# EasyEDA Pro project 恒温器.eprj, board PCB3
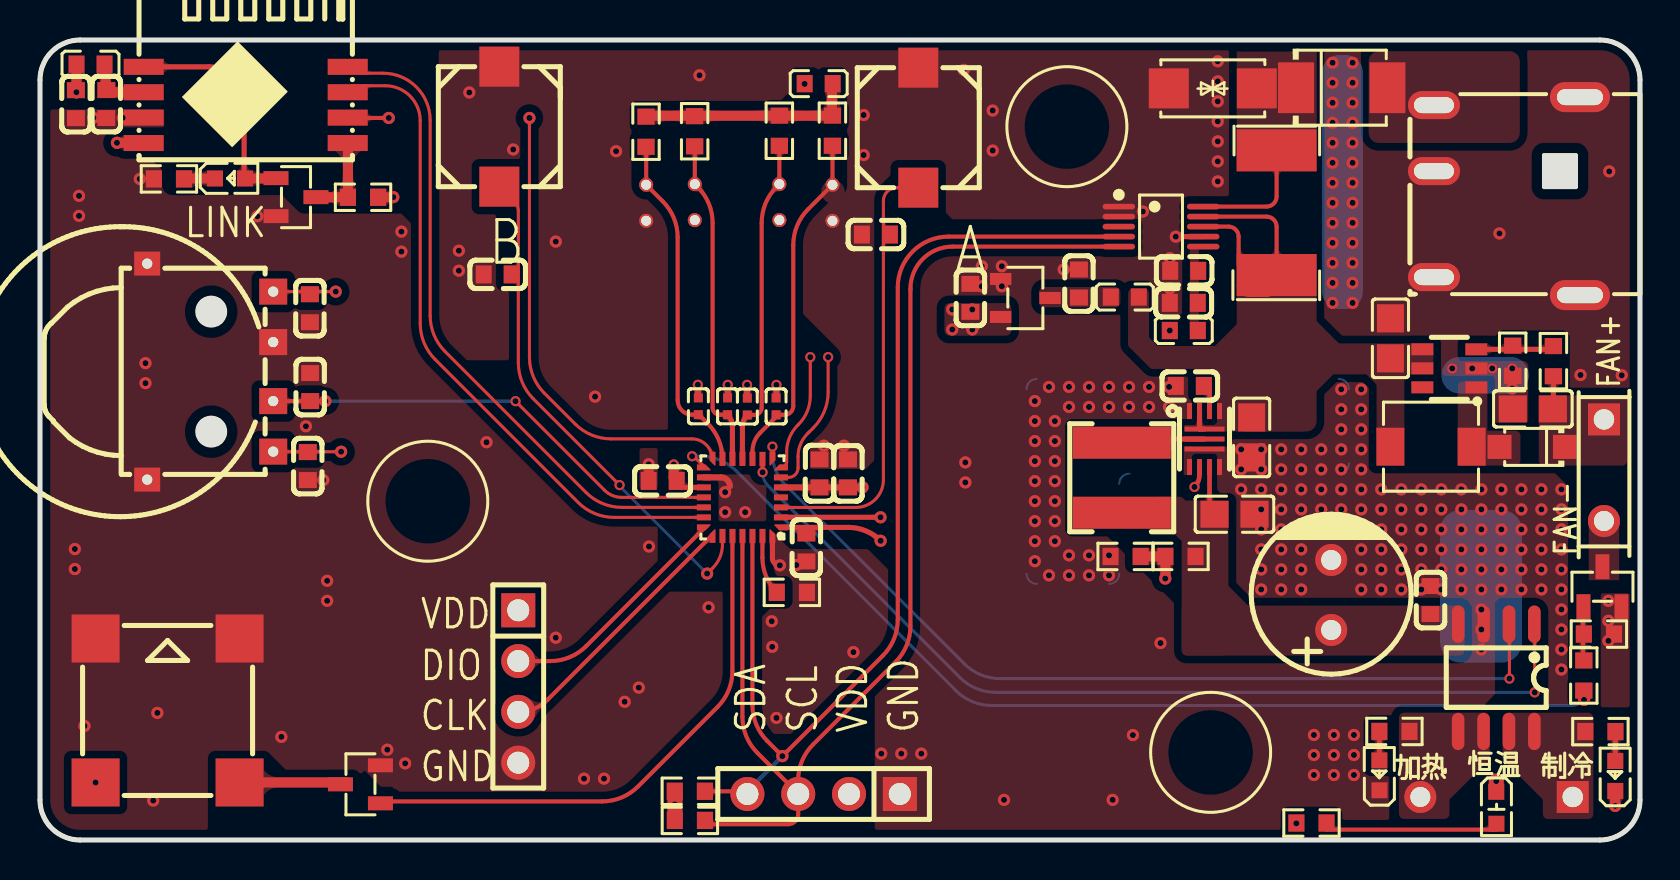
[diagram p1: board, top side]
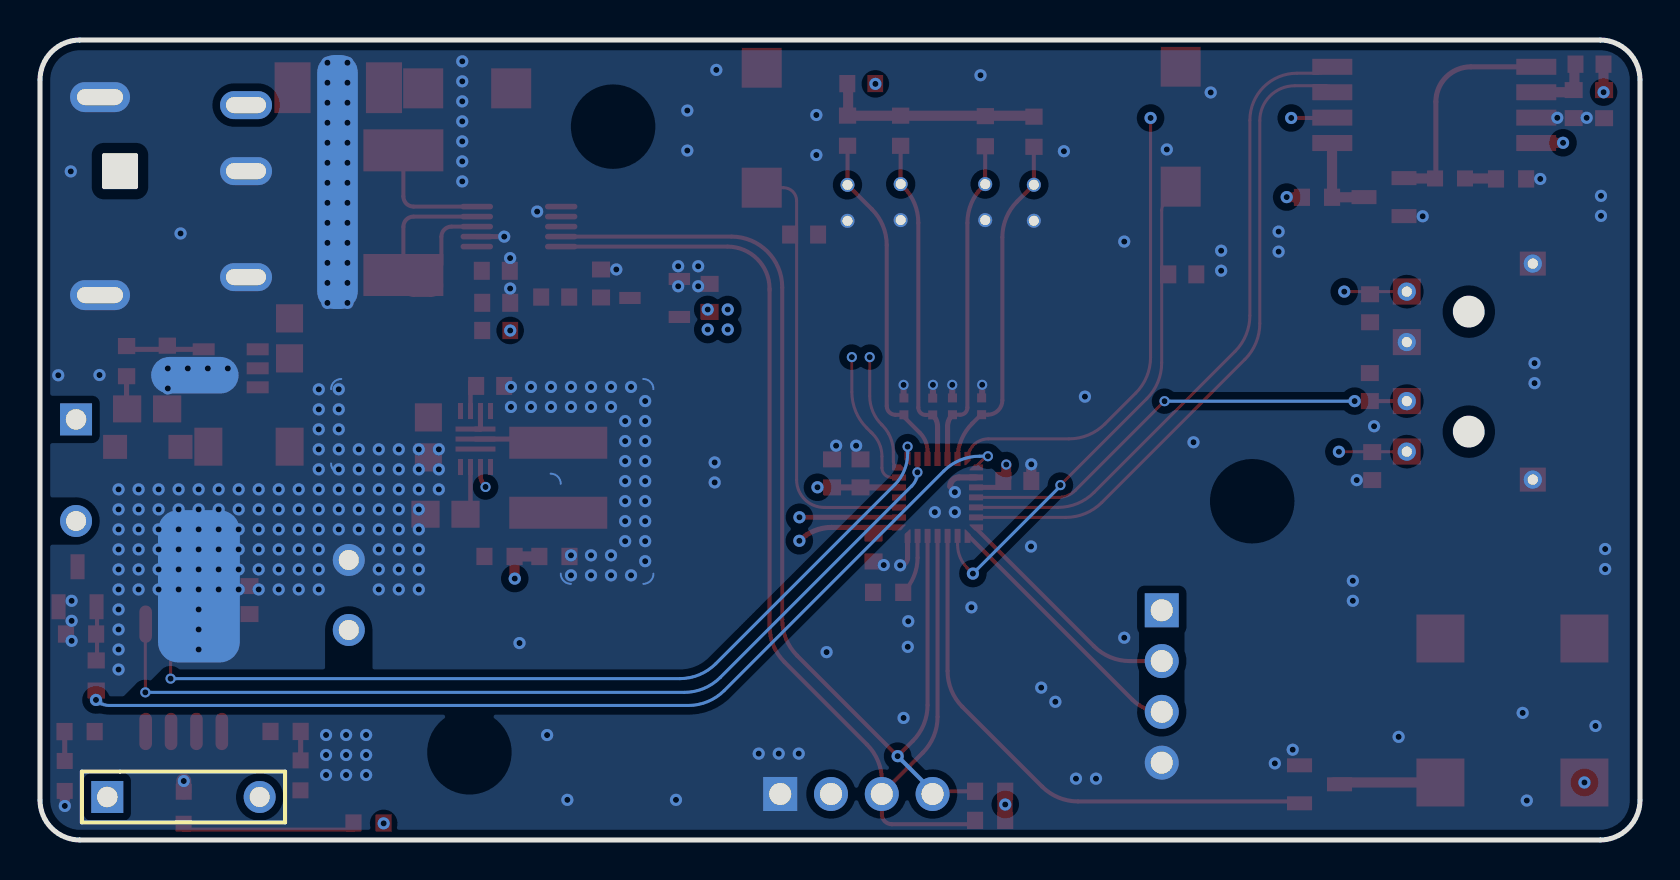
[diagram p2: board, bottom side, seen from below]

Outline 80 x 40 mm; copper layers: Top Layer, Inner1, Inner2, Bottom Layer. Coordinates in mm from the lower left corner of the outline.
Outline path: 0,38 0,2 arc(0.59,0.59) 2,0 78,0 arc(79.41,0.59) 80,2 80,38 arc(79.41,39.41) 78,40 2,40 arc(0.59,39.41) 0,38
Stack: Top Layer 0.035mm 外层铜厚1oz / Dielectric1 0.2104mm 7628 RC49% 8.6mil / Inner1 0.0152mm 内层铜厚 / Dielectric2 1.065mm 1.1mm H/HOZ Copper / Inner2 0.0152mm 内层铜厚 / Dielectric3 0.2104mm 7628 RC49% 8.6mil / Bottom Layer 0.035mm 外层铜厚1oz

## Design rules (mm)
template: 自定义配置
spacing copperThickness1oz (default): track to track 0.102, other pairs 0.152 to 0.3
spacing copperThickness2oz: track to track 0.203, other pairs 0.152 to 0.3
track width copperThickness1oz (default): min 0.127, default 0.254, max 2.54
track width copperThickness2oz: min 0.203, default 0.254, max 2.54
differential pair differentialPair (default): width min 0.127, default 0.254, max 2.54; gap min 0.152, default 0.152
via viaSize (default): diameter min 0.5, default 0.61, max 10; hole min 0.3, default 0.305, max 6.3

## Placement (name value [footprint] x y rotation side)
BUZZER1  2.7kHz  [BUZ-SMD_4P-L8.5-W8.5-P8.50-BR]  6.38 6.48 0 top
C200  100nF  [C0402]  36.8 21.68 270 top
C248  100nF  [C0603]  38.97 18.33 270 top
C249  100nF  [C0603]  31.14 17.95 0 top
C250  100nF  [C0603]  38.32 14.63 90 top
C258  10uF  [C0603]  40.4 18.33 270 top
C6075551  10nF  [C0603]  22.88 28.28 0 top
C6075567  2.2uF  [C0603]  51.95 27.82 270 top
C6075568  2.2uF  [C0603]  46.52 27.11 270 top
C6075571  100nF  [C0603]  69.52 12 270 top
C6075578  470uF  [CAP-TH_BD8.0-P3.50-D0.6-FD]  64.56 12.25 90 top
C6075579  100nF  [C0603]  57.19 26.86 0 top
C6075591  10nF  [C0603]  41.8 30.27 0 top
C6075596  10nF  [C0603]  13.39 18.7 270 top
C6075597  10nF  [C0603]  13.51 22.65 90 top
C6075598  10nF  [C0603]  13.5 26.59 270 top
C6075599  100nF  [C0402]  35.37 21.67 270 top
C6075600  100nF  [C0402]  34.37 21.68 270 top
C6075601  100nF  [C0402]  32.92 21.69 270 top
C6075602  22uF  [C0805]  60.58 20.13 270 top
C6075603  22uF  [C0805]  59.73 16.29 180 top
C6075605  10nF  [C0603]  57.49 22.7 0 top
C6075608  10uF  [C0805]  74.64 21.56 0 top
C6075609  10uF  [C0805]  67.52 25.08 270 top
C6075610  2.2uF  [C0603]  57.21 28.46 0 top
C6075611  2.2uF  [C0603]  1.8 36.79 90 top
C6075612  2.2uF  [C0603]  3.32 36.8 90 top
D5  SMAJ15CA  [SMA_L4.3-W2.6-LS5.0-BI]  58.64 37.58 0 top
D6  SSL54B  [SMBF_L4.3-W3.6-LS5.3-RD]  65.09 37.62 0 top
D8  DSK24  [SOD-123FL_L2.7-W1.8-LS3.8-RD]  74.61 19.66 180 top
DC1  DC-044B-25  [DC-IN-TH_DC-044B-25]  73.35 32.19 180 top
H9  CS-1109-1X4N2,3B(L12.0)  [HDR-TH_CS-1109-1X4N2-3B#2]  72.83 2.15 180 bottom
H10  CS-1109-1X4N2,3B(L12.0)  [HDR-TH_CS-1109-1X4N2-3B]  78.2 19.76 270 top
H11  PZ254V-11-04P  [HDR-TH_4P-P2.54-V-M]  23.91 7.68 270 top
H12  PM254V-11-04-H85  [HDR-TH_4P-P2.54-V-F]  39.18 2.3 180 top
KEY2  TS1179S16050  [KEY-SMD_L6.1-W6.0-LS6.7]  22.97 35.67 90 top
KEY3  TS1179S16050  [KEY-SMD_L6.1-W6.0-LS6.7]  43.91 35.62 90 top
L17  UPZ1608E221-2R2TF  [L0603]  2.53 38.79 0 top
L18  GZ1608D601TF  [L0603]  54.24 27.15 180 top
L19  GZ1608D601TF  [L0603]  57.19 25.47 0 top
L20  GZ1608D601TF  [L0603]  38.93 37.82 0 top
L21  1.2uH  [IND-SMD_L5.2-W5.4]  54.09 18.11 270 top
L22  22uH  [IND-SMD_L4.6-W4.2_SMMS0420]  69.55 19.67 0 top
LED4  NCD0603B1  [LED0603-RD]  78.76 3.2 90 top
LED7  NCD0603B1  [LED0603-RD]  9.5 33.08 0 top
LED8  NCD0603R1  [LED0603-RD_RED]  66.97 3.23 90 top
LED9  NCD0603G1  [LED0603-RD_1]  72.82 1.61 270 top
NOREF  -  [Pad_e332]  11.66 19.42 0 top
NOREF#2  -  [Pad_e328]  5.36 28.82 0 top
NOREF#3  -  [Pad_e6148]  57.39 20.69 0 top
NOREF#4  -  [Pad_e333]  5.36 18.02 0 top
NOREF#5  -  [Pad_e7051]  72.26 23.24 0 top
NOREF#6  -  [Pad_e330]  11.66 24.89 0 top
NOREF#7  -  [Pad_e8678]  72.05 12.68 0 top
NOREF#8  -  [Pad_e331]  11.66 21.94 0 top
NOREF#9  -  [Pad_e329]  11.66 27.42 0 top
NOREF#10  -  [Pad_e157]  65.13 32.9 0 top
Q47  HL2310A  [SOT-23-3_L2.9-W1.3-P1.90-LS2.4-BR]  78.12 12.66 270 top
Q48  HL2310A  [SOT-23-3_L2.9-W1.3-P1.90-LS2.4-BR]  16.02 2.78 0 top
Q49  HL2310A  [SOT-23-3_L2.9-W1.3-P1.90-LS2.4-BR]  12.8 32.14 180 top
R152  10kΩ  [R0603]  37.59 12.38 0 top
R4196  4.7kΩ  [R0603]  6.45 33.06 180 top
R4197  4.7kΩ  [R0603]  67.72 5.43 0 top
R4198  4.7kΩ  [R0603]  78.02 5.42 180 top
R4208  10kΩ  [R0603]  77.95 10.3 180 top
R4211  4.7kΩ  [R0603]  63.57 0.85 180 top
R4224  10kΩ  [R0603]  39.62 35.47 90 top
R4237  10kΩ  [R0603]  16.15 32.14 180 top
R4238  20mΩ  [R2512]  61.83 31.37 90 top
R4244  100Ω  [R0603]  77.19 8.22 270 top
R4245  10kΩ  [R0603]  36.97 35.46 90 top
R4246  10kΩ  [R0603]  32.73 35.44 90 top
R4247  10kΩ  [R0603]  30.3 35.41 90 top
R4250  84.5kΩ  [R0603]  57.02 14.18 0 top
R4251  84.5kΩ  [R0603]  75.67 23.94 90 top
R4252  2.2kΩ  [R0603]  73.64 23.96 270 top
R4253  4.7kΩ  [R0603]  32.49 2.44 180 top
R4254  4.7kΩ  [R0603]  32.49 0.98 180 top
SW1  SIQ-02FVS3  [SW-SMD_SIQ-02FVS3]  8.51 23.42 90 top
U58  STM32L031G6U6  [UFQFPN-28_L4.0-W4.0-P0.50-BL]  35.12 17.13 90 top
U212  BLE-SER-A-ANT  [WIFI-SMD_8P-P1.27_CH9140]  10.29 36.75 0 top
U215  SK6512SS3-33  [SOT-23-3_L2.9-W1.6-P1.90-LS2.8-BR]  49.27 27.1 180 top
U219  CP3119MDTR(XBLW)  [SOP-8_L4.9-W3.9-P1.27-LS6.0-BL]  72.81 8.11 180 top
U228  INA226AIDGSR  [MSOP-10_L3.0-W3.0-P0.50-LS5.0-BL]  56.05 30.67 270 top
U235  MT52B103F3950F01000  [RES-TH_BD2.0-P1.80-D0.3]  39.62 31.86 90 top
U236  MT52B103F3950F01000  [RES-TH_BD2.0-P1.80-D0.3]  36.97 31.9 90 top
U237  MT52B103F3950F01000  [RES-TH_BD2.0-P1.80-D0.3]  32.74 31.89 90 top
U238  MT52B103F3950F01000  [RES-TH_BD2.0-P1.80-D0.3]  30.31 31.86 90 top
U241  TPS62135RGXR  [VQFN-HR-11_L3.0-W2.0-P0.50_TPS62135RGXR]  58.23 20.05 180 top
U242  8kΩ  [R0603]  54.28 14.18 0 top
U243  TX4211  [SOT-23-6_L2.9-W1.6-P0.95-LS2.8-BR]  70.47 23.58 0 top

## Footprints (pads in the part's own frame, mm; a bottom-side part is the same pattern mirrored in y, then rotated)
BUZ-SMD_4P-L8.5-W8.5-P8.50-BR
  rect 2.4x2.4 smd: 1(-3.6,-3.6) 2(3.6,-3.6) 3(3.599,3.599) 4(-3.6,3.6)
C0402
  rect 0.45x0.45 smd: 1(-0.42,-0.001) 2(0.42,-0.001)
C0603
  rect 0.8x0.9 smd: 1(-0.7,0) 2(0.7,0)
C0805
  rect 1.41x1.35 smd: 1(-1,0) 2(1,0)
CAP-TH_BD8.0-P3.50-D0.6-FD
  round 1.6 hole 1: 1(-1.75,0) 2(1.75,0)
DC-IN-TH_DC-044B-25
  oval 2.6x1.4 hole 2x0.8: 1(3.65,-4.55) 2(3.65,4.05) 3(3.65,-1.25)
  oval 3x1.5 hole 2.3x0.8: 5(-3.65,4.95) 5(-3.65,-4.95)
HDR-TH_4P-P2.54-V-F
  rect 1.7x1.7 hole 1.1: 1(-3.81,0)
  round 1.7 hole 1.1: 2(-1.27,0) 3(1.27,0) 4(3.81,0)
HDR-TH_4P-P2.54-V-M
  rect 1.7x1.7 hole 1.1: 1(-3.81,0)
  round 1.7 hole 1.1: 2(-1.27,0) 3(1.27,0) 4(3.81,0)
HDR-TH_CS-1109-1X4N2-3B
  rect 1.6x1.6 hole 1.02: 1(-1.27,0)
  round 1.6 hole 1: 4(3.81,0)
HDR-TH_CS-1109-1X4N2-3B#2
  rect 1.6x1.6 hole 1.02: 1(-3.81,0)
  round 1.6 hole 1: 4(3.81,0)
IND-SMD_L4.6-W4.2_SMMS0420
  rect 1.4x1.9 smd: 1(2.032,0) 2(-2.032,0)
IND-SMD_L5.2-W5.4
  rect 1.6x4.9 smd: 1(-1.75,0) 2(1.75,0)
KEY-SMD_L6.1-W6.0-LS6.7
  rect 2x2 smd: 1(-3,0) 2(3,0)
L0603
  rect 0.8x0.864 smd: 1(-0.7,0) 2(0.7,0)
LED0603-RD
  rect 0.8x0.8 smd: 1(-0.749,0) 2(0.749,0)
LED0603-RD_1
  rect 0.8x0.8 smd: 1(-0.799,-0.004) 2(0.799,0.004)
LED0603-RD_RED
  rect 0.8x0.8 smd: 1(-0.749,-0.004) 2(0.749,0.004)
MSOP-10_L3.0-W3.0-P0.50-LS5.0-BL
  oval 0.28x1.62 smd: 1(-1,-2.11) 2(-0.5,-2.11) 3(0,-2.11) 4(0.5,-2.11) 5(1,-2.11) 6(1,2.11) 7(0.5,2.11) 8(0,2.11) 9(-0.5,2.11) 10(-1,2.11)
Pad_e157
  rrect 2.032x12.7 smd far side: 2(0,0)
Pad_e328
  round 0.914 hole 0.508: 1(0,0)
Pad_e329
  round 0.914 hole 0.508: 1(0,0)
Pad_e330
  round 0.914 hole 0.508: 1(0,0)
Pad_e331
  round 0.914 hole 0.508: 1(0,0)
Pad_e332
  round 0.914 hole 0.508: 1(0,0)
Pad_e333
  round 0.914 hole 0.508: 1(0,0)
Pad_e6148
  custom 16.116x10.245 smd far side: 1(0,0)
Pad_e7051
  rrect 4.376x1.831 smd far side: 2(0,0)
Pad_e8678
  rrect 4.092x7.62 smd far side: 2(0,0)
R0603
  rect 0.806x0.864 smd: 1(-0.753,0) 2(0.753,0)
R2512
  rect 2.1x4 smd: 1(-3.116,0) 2(3.116,0)
RES-TH_BD2.0-P1.80-D0.3
  round 0.7 hole 0.5: 1(-0.9,0) 2(0.9,0)
SMA_L4.3-W2.6-LS5.0-BI
  rect 2x2 smd: 1(-2.2,0) 2(2.2,0)
SMBF_L4.3-W3.6-LS5.3-RD
  rect 1.8x2.54 smd: 1(-2.285,0) 2(2.285,0)
SOD-123FL_L2.7-W1.8-LS3.8-RD
  rect 1.2x1.2 smd: 1(-1.635,0) 2(1.635,0)
SOP-8_L4.9-W3.9-P1.27-LS6.0-BL
  oval 0.63x1.865 smd: 1(-1.905,-2.683) 2(-0.635,-2.683) 3(0.635,-2.683) 4(1.905,-2.683) 5(1.905,2.683) 6(0.635,2.683) 7(-0.635,2.683) 8(-1.905,2.683)
SOT-23-3_L2.9-W1.3-P1.90-LS2.4-BR
  rect 1.25x0.7 smd: 1(1,-0.95) 2(1,0.95) 3(-1,0)
SOT-23-3_L2.9-W1.6-P1.90-LS2.8-BR
  rect 1.07x0.6 smd: 1(1.235,-0.95) 2(1.235,0.95) 3(-1.235,0)
SOT-23-6_L2.9-W1.6-P0.95-LS2.8-BR
  rect 1.1x0.6 smd: 1(1.35,-0.95) 2(1.35,0) 3(1.35,0.95) 4(-1.35,0.95) 5(-1.35,0) 6(-1.35,-0.95)
SW-SMD_SIQ-02FVS3
  rect 1.2x1.3 smd: 1(-5.4,3.15) 2(5.4,3.15)
  rect 1.3x1.4 smd: A(-4,-3.15) B(4,-3.15) C(1.475,-3.15) S(-1.475,-3.15)
UFQFPN-28_L4.0-W4.0-P0.50-BL
  custom 0.3x0.675 smd: 1(-1.5,-1.875) 7(1.5,-1.875) 15(1.5,1.875) 21(-1.5,1.875)
  rect 0.3x0.7 smd: 2(-1,-1.925) 3(-0.5,-1.925) 4(0,-1.925) 5(0.5,-1.925) 6(1,-1.925) 16(1,1.925) 17(0.5,1.925) 18(0,1.925) 19(-0.5,1.925) 20(-1,1.925)
  custom 0.675x0.3 smd: 8(1.875,-1.5) 14(1.875,1.5) 22(-1.875,1.5) 28(-1.875,-1.5)
  rect 0.7x0.3 smd: 9(1.925,-1) 10(1.925,-0.5) 11(1.925,0) 12(1.925,0.5) 13(1.925,1) 24(-1.925,0.5) 25(-1.925,0) 26(-1.925,-0.5) 27(-1.925,-1)
  custom 0.7x0.3 smd: 23(-1.925,1)
VQFN-HR-11_L3.0-W2.0-P0.50_TPS62135RGXR
  rect 2x0.25 smd: 1(0,-0.5) 2(0,0) 3(0,0.5)
  rect 0.25x0.8 smd: 4(0.75,1.4) 5(0.25,1.4) 6(-0.25,1.4) 7(-0.75,1.4) 8(-0.75,-1.4) 9(-0.25,-1.4) 10(0.25,-1.4) 11(0.75,-1.4)
WIFI-SMD_8P-P1.27_CH9140
  rect 2x0.8 smd: 1(-5.1,1.905) 2(-5.1,0.635) 3(-5.1,-0.635) 4(-5.1,-1.905) 5(5.1,-1.905) 6(5.1,-0.635) 7(5.1,0.635) 8(5.1,1.905)

## Nets
As in the schematic, except:
GND: BUZZER1.3 BUZZER1.4 C200.1 C248.1 C249.1 C250.1 C258.1 C6075551.1 C6075567.1 C6075568.1 C6075571.1 C6075578.2 C6075579.1 C6075591.1 C6075596.2 C6075597.2 C6075598.2 C6075599.1 C6075600.1 C6075601.1 C6075602.2 C6075603.1 C6075605.1 C6075608.1 C6075609.1 C6075610.1 C6075611.1 C6075612.1 D5.1 DC1.2 DC1.3 DC1.5 H11.4 H12.1 KEY2.2 KEY3.2 LED4.1 LED8.1 LED9.1 NOREF#2.1 NOREF#3.1 NOREF#4.1 NOREF#5.2 NOREF#6.1 NOREF#7.2 NOREF#10.2 Q47.2 Q48.2 Q49.2 R152.2 R4196.2 R4208.1 R4252.2 SW1.1 SW1.2 SW1.C U58.16 U58.28 U212.3 U215.1 U219.3 U228.1 U228.2 U228.7 U235.1 U236.1 U237.1 U238.1 U241.3 U241.4 U241.7 U241.11 U242.1 U243.2
LLL: C6075596.1 NOREF.1 SW1.A U58.7
PRES: C6075597.1 NOREF#8.1 SW1.S U58.18
RRR: C6075598.1 NOREF#9.1 SW1.B U58.6

Pads without a net: U228 3; U243 6

## Via types
v1: diameter 0.61, hole 0.305, Top Layer to Bottom Layer, 303 vias
v2: diameter 0.508, hole 0.305, Top Layer to Bottom Layer, 19 vias

## Routing (per net, layer and track width the routed paths; a pad name or vN(x,y) marks a point on that pad's centre or on a via; arc(x,y) is an arc through that point)
8.1V: length 2.6
  Top Layer w0.229: U241.6 58.48,16.09 arc(58.48,16.08) 58.48,16.08
12V: length 13
  Top Layer w0.203: U228.9 61.32,31.17 arc(61.68,31.02) 61.83,30.66 61.83,28.76 ; U228.8 59.42,30.67 arc(59.78,30.52) 59.93,30.16 59.93,28.76 ; 59.94,27.76 arc(60.09,27.4) 60.44,27.26 61.33,27.26 arc(61.69,27.4) 61.84,27.76
  Top Layer w0.254: U241.1 57.98,20.55 U241.10
12VIN: length 6.3
  Top Layer w0.203: 61.83,34.48 61.83,32.18 arc(61.68,31.82) 61.32,31.67 U228.10
24V: length 1.6
  Top Layer w0.254: 75.67,23.1 75.67,21.6 arc(75.66,21.57) 75.64,21.57
GND: length 9.4
  Top Layer w0.254: U58.28 36.62,14.07 arc(36.74,13.83) v1(36.99,13.73) ; U228.7 56.8,30.17 arc(56.79,30.17) v1(56.79,30.17)
  Top Layer w0.305: v2(36.82,22.76) 36.82,22.14 arc(36.82,22.12) C200.1 ; U58.16 34.05,18.13 arc(34.36,18) 34.49,17.68 ; v2(34.39,22.76) 34.39,22.13 arc(34.38,22.11) C6075600.1 ; v2(35.35,22.76) 35.35,22.12 arc(35.36,22.11) 35.37,22.09 ; v2(32.89,22.76) 32.89,22.17 arc(32.9,22.14) C6075601.1
  Top Layer w0.508: v1(78.76,1.7) 78.76,2.44 arc(78.76,2.45) LED4.1 ; v1(30.44,18.78) 30.44,17.95
  Top Layer w0.75: v1(72.81,2.95) LED9.1
  vias: v1(1.74,14.55) v1(1.74,13.55) v1(1.95,32.21) v1(1.95,31.21) v1(2.22,5.7) v1(2.67,36.11) v1(4.14,36.11) v1(4.99,33.05) v1(5.27,23.84) v1(5.27,22.84) v1(5.66,1.97) v1(5.87,6.36) v1(10.87,31.19) v1(12.07,5.16) v1(13.3,20.69) v1(14.16,18) v1(14.36,12.96) v1(14.36,11.96) v1(17.37,4.52) v1(18.07,30.42) v1(18.07,29.42) v1(18.26,3.83) v1(20.94,29.47) v1(20.94,28.46) v1(21.47,37.38) v1(22.33,19.89) v1(23.66,34.53) v1(25.79,29.92) v1(25.79,10.12) v1(27.2,3.07) v1(27.75,22.17) v1(28.2,3.07) v1(28.8,34.44) v1(29.23,6.91) v1(29.94,7.62) v1(30.45,14.67) v1(32.98,38.24) v1(33.43,11.63) v1(34.26,17.39) v1(34.26,16.39) v1(35.26,16.39) v1(36.59,10.94) v1(36.61,9.66) v1(36.82,6.1) v1(37.81,13.75) v1(39.19,19.72) v1(40.19,19.72) v1(40.67,9.39) v1(41.18,36.25) v1(41.18,34.25) v1(42.06,4.32) v1(43.06,4.32) v1(44.07,4.32) v1(46.18,38.5) v1(46.27,18.88) v1(46.27,17.88) v1(47.09,28.69) v1(47.09,27.69) v1(47.64,36.47) v1(47.64,34.47) v1(48.09,28.69) v1(48.09,27.69) v1(48.2,2.01) v1(49.74,21.95) v1(49.74,20.95) v1(49.74,19.95) v1(49.74,18.94) v1(49.74,17.94) v1(49.74,16.94) v1(49.74,15.94) v1(49.74,14.94) v1(49.74,13.94) v1(50.45,22.65) v1(50.45,13.23) v1(50.74,20.95) v1(50.74,19.95) v1(50.74,18.94) v1(50.74,17.94) v1(50.74,16.94) v1(50.74,15.94) v1(50.74,14.94) v1(51.18,28.53) v1(51.45,22.65) v1(51.45,21.65) v1(51.45,14.23) v1(51.45,13.23) v1(52.45,22.65) v1(52.45,21.65) v1(52.45,14.23) v1(52.45,13.23) v1(53.45,22.65) v1(53.45,21.65) v1(53.45,14.23) v1(53.45,13.23) v1(53.63,2.01) v1(54.45,22.65) v1(54.45,21.65) v1(54.65,5.25) v1(55.14,31.42) v1(55.45,22.65) v1(55.45,21.65) v1(56.03,9.85) v1(56.45,22.65) v1(56.45,21.65) v1(56.49,29.09) v1(56.49,27.57) v1(58.89,38.93) v1(58.89,37.93) v1(58.89,36.93) v1(58.89,35.93) v1(58.89,34.93) v1(58.89,33.93) v1(58.89,32.93) v1(60.06,19.53) v1(60.06,18.53) v1(60.06,17.53) v1(61.06,19.53) v1(61.06,18.53) v1(61.06,17.53) v1(61.06,16.53) v1(61.06,15.53) v1(61.06,14.53) v1(61.06,13.53) v1(61.06,12.53) v1(62.06,19.53) v1(62.06,18.53) v1(62.06,17.53) v1(62.06,16.53) v1(62.06,15.53) v1(62.06,14.53) v1(62.06,13.53) v1(62.06,12.53) v1(63.06,19.53) v1(63.06,18.53) v1(63.06,17.53) v1(63.06,16.53) v1(63.06,15.53) v1(63.06,14.53) v1(63.06,13.53) v1(63.06,12.53) v1(63.7,5.25) v1(63.7,4.25) v1(63.7,3.25) v1(64.06,19.53) v1(64.06,18.53) v1(64.06,17.53) v1(64.06,16.53) v1(64.06,15.53) v1(64.63,38.86) v1(64.63,37.86) v1(64.63,36.86) v1(64.63,35.86) v1(64.63,34.86) v1(64.63,33.86) v1(64.63,32.86) v1(64.63,31.86) v1(64.63,30.86) v1(64.63,29.86) v1(64.63,28.86) v1(64.63,27.86) v1(64.63,26.86) v1(64.7,5.25) v1(64.7,4.25) v1(64.7,3.25) v1(65.06,22.54) v1(65.06,21.53) v1(65.06,20.53) v1(65.06,19.53) v1(65.06,18.53) v1(65.06,17.53) v1(65.06,16.53) v1(65.06,15.53) v1(65.63,38.86) v1(65.63,37.86) v1(65.63,36.86) v1(65.63,35.86) v1(65.63,34.86) v1(65.63,33.86) v1(65.63,32.86) v1(65.63,31.86) v1(65.63,30.86) v1(65.63,29.86) v1(65.63,28.86) v1(65.63,27.86) v1(65.63,26.86) v1(65.7,5.25) v1(65.7,4.25) v1(65.7,3.25) v1(66.06,22.53) v1(66.06,21.53) v1(66.06,20.53) v1(66.06,19.53) v1(66.06,18.53) v1(66.06,17.53) v1(66.06,16.53) v1(66.06,15.53) v1(66.06,14.53) v1(66.06,13.53) v1(66.06,12.53) v1(67.06,17.53) v1(67.06,16.53) v1(67.06,15.53) v1(67.06,14.53) v1(67.06,13.53) v1(67.06,12.53) v1(68.07,17.53) v1(68.07,16.53) v1(68.07,15.53) v1(68.07,14.53) v1(68.07,13.53) v1(68.07,12.53) v1(69.07,17.53) v1(69.07,16.53) v1(69.07,15.53) v1(69.07,14.53) v1(69.07,13.53) v1(69.07,12.53) v1(70.07,17.53) v1(70.07,16.53) v1(70.07,15.53) v1(70.07,14.53) v1(70.07,13.53) v1(70.07,12.53) v1(71.07,17.53) v1(71.07,16.53) v1(71.07,15.53) v1(71.07,14.53) v1(71.07,13.53) v1(71.07,12.53) v1(72.07,17.53) v1(72.07,16.53) v1(72.07,15.53) v1(72.07,14.53) v1(72.07,13.53) v1(72.07,12.53) v1(72.07,11.53) v1(72.07,10.53) v1(72.07,9.53) v1(72.97,30.33) v1(73.07,17.53) v1(73.07,16.53) v1(73.07,15.53) v1(73.07,14.53) v1(73.07,13.53) v1(73.07,12.53) v1(73.61,22.58) v1(74.07,17.53) v1(74.07,16.53) v1(74.07,15.53) v1(74.07,14.53) v1(74.07,13.53) v1(74.07,12.53) v1(75.07,17.53) v1(75.07,16.53) v1(75.07,15.53) v1(75.07,14.53) v1(75.07,13.53) v1(75.07,12.53) v1(76.07,17.53) v1(76.07,16.53) v1(76.07,15.53) v1(76.07,14.53) v1(76.07,13.53) v1(76.07,12.53) v1(76.07,11.53) v1(76.07,10.53) v1(76.07,9.53) v1(76.07,8.52) v1(77.03,23.25) v1(78.46,33.43) v1(78.42,11.96) v1(78.42,10.96) v1(78.42,9.96) v1(79.09,23.24) v2(70.61,23.58) v2(71.61,23.58) v2(72.61,23.58) v2(73.61,23.58)
VDD: length 16.6
  Top Layer w0.203: v1(17.67,32.15) arc(17.65,32.14) 17.64,32.14
  Top Layer w0.254: U58.17 32.16,17.63 arc(31.93,17.72) C249.2 ; U58.1 40.41,15.63 arc(41.29,15.46) v1(42.03,14.96)
  Top Layer w0.305: U58.5 C248.2 C258.2 41.12,17.63 arc(41.13,17.63) v1(41.13,17.64)
  Top Layer w0.508: L17.1 1.83,37.34 arc(1.82,37.34) 1.82,37.33 ; v1(3.85,34.86) 5.16,34.86 arc(5.17,34.86) U212.4 ; 17.64,32.14 R4237.1 ; v2(31.69,18.77) 31.69,18.11 31.84,17.96 arc(31.84,17.95) C249.2
  Top Layer w0.75: 31.75,1.12 31.75,2.43 arc(31.74,2.43) 31.74,2.44
  vias: v1(1.82,37.39) v1(2.78,2.88) v1(31.74,1.77) v1(38.23,37.81) v1(45.61,26.53) v1(45.61,25.52) v1(46.61,26.53) v1(46.61,25.52) v1(56.49,25.47)
VDD1: length 10.7
  Top Layer w0.508: 39.62,36.21 R4245.2 30.35,36.21 arc(30.32,36.2) R4247.2 ; 39.59,37.56 39.59,36.29 arc(39.6,36.25) R4224.2
A: length 22
  Top Layer w0.152: KEY3.1 42.83,32.62 arc(42.36,32.42) 42.17,31.96 42.17,18.01 arc(41.77,17.03) 40.79,16.63 arc(40.76,16.63) 40.74,16.63 37.05,16.63 arc(37.05,16.63) U58.3
B: length 25.8
  Top Layer w0.152: 34.12,15.2 34.12,14.77 arc(34,14.14) 33.64,13.6 v1(33.36,13.32) ; KEY2.1 23.75,31.88 arc(23.87,31.7) 23.92,31.48 23.92,23.86 arc(24.11,22.89) 24.66,22.07 v2(28.98,17.75)
  Bottom Layer w0.152: 33.44,13.49 arc(33.38,13.42) v1(33.36,13.32) 29.01,17.66 arc(28.99,17.7) v2(28.98,17.75)
BOOT0: length 3
  Top Layer w0.203: U58.27 36.12,14.11 arc(36.31,13.18) R152.1
BUZZ: length 27.2
  Top Layer w0.203: U58.24 34.62,8.45 arc(34.43,7.48) 33.88,6.65 29.9,2.67 arc(29.07,2.12) 28.1,1.93 17.32,1.93
BVCC: length 3.3
  Top Layer w0.508: U212.2 3.28,37.39 3.28,38.73 arc(3.26,38.77) L17.2
CONS: length 32
  Top Layer w0.254: v1(42.03,16.14) 37.05,16.14 U58.2
  Inner2 w0.254: v1(62.82,0.83) 58.38,0.83 arc(57.41,1.03) 56.59,1.58 v1(42.03,16.14)
FANPWM: length 50.9
  Top Layer w0.152: U58.15 32.75,19.13 arc(32.7,19.17) 32.64,19.19 arc(32.62,19.19) v2(32.6,19.19)
  Top Layer w0.61: v1(77.2,7) 77.2,7.44 arc(77.2,7.46) 77.19,7.47
  Bottom Layer w0.152: v2(32.6,19.19) 33.02,19.19 arc(33.99,19) 34.82,18.45 45.79,7.47 arc(46.61,6.92) 47.59,6.73 76.53,6.73 arc(76.89,6.8) v1(77.2,7)
HEATPWM: length 45.6
  Top Layer w0.152: v2(73.47,8.07) 73.47,10.75 73.46,10.77 arc(73.46,10.78) U219.2
  Top Layer w0.203: v2(36.62,19.67) 36.62,19.04 36.63,19.03 arc(36.63,19.02) U58.8
  Bottom Layer w0.152: v2(73.47,8.07) 48.01,8.07 arc(47.04,8.26) 46.21,8.81 37.26,17.76 arc(36.79,18.47) 36.62,19.31 v2(36.62,19.67)
LINK: length 11.4
  Top Layer w0.254: U212.1 8.46,38.66 arc(9.69,38.15) 10.21,36.91 10.21,33.12 arc(10.22,33.09) LED7.2
  Top Layer w0.508: LED7.2 11.79,33.08 arc(11.79,33.08) 11.79,33.09
LLL: length 36.5
  Top Layer w0.152: U58.7 37.05,18.63 arc(37.25,18.71) 37.33,18.91 37.33,19.39 arc(37.39,19.87) 37.57,20.32 arc(37.72,20.54) 37.89,20.75 37.93,20.78 arc(38.36,21.43) 38.51,22.2 v2(38.51,24.14) ; v1(15.06,19.41) 11.67,19.41 arc(11.66,19.41) NOREF.1
  Inner2 w0.152: v1(15.06,19.41) 15.06,21.6 arc(15.8,23.4) 17.6,24.14 v2(38.51,24.14)
MRTS: length 32.9
  Top Layer w0.152: v1(24.47,36.1) 24.47,24.14 arc(24.67,23.17) 25.22,22.34 26.76,20.8 arc(27.58,20.25) 28.55,20.06 32.58,20.06 arc(33.32,19.75) 33.62,19.02 U58.14
  Top Layer w0.203: v1(17.44,36.1) 15.4,36.1 arc(15.39,36.11) U212.6
  Inner2 w0.152: v1(17.44,36.1) v1(24.47,36.1)
MRX: length 33.5
  Top Layer w0.152: U58.20 28.71,16.13 arc(27.73,16.32) 26.91,16.87 19.75,24.03 arc(19.2,24.85) 19.01,25.83 19.01,35.97 arc(18.5,37.2) 17.26,37.71 15.71,37.71 arc(15.48,37.62) U212.7
MTX: length 33.4
  Top Layer w0.152: U58.19 29.1,16.63 arc(28.13,16.82) 27.3,17.37 20.25,24.43 arc(19.7,25.25) 19.51,26.22 19.51,35.99 arc(18.82,37.65) 17.15,38.34 16.16,38.34 arc(15.74,38.42) U212.8
NTC1: length 17.4
  Top Layer w0.203: C200.2 37.23,21.26 arc(37.54,21.39) 37.66,21.7 37.66,29.74 arc(37.86,30.72) 38.41,31.54 U235.2 39.62,34.7 arc(39.62,34.71) R4224.1 ; U58.10 35.62,19.42 arc(35.72,19.93) 36.01,20.37 36.86,21.21
NTC2: length 16.5
  Top Layer w0.203: R4245.1 U236.2 36.83,32.66 arc(36.28,31.83) 36.08,30.86 36.08,21.62 arc(35.98,21.36) 35.72,21.25 C6075599.2
  Top Layer w0.254: U58.11 35.12,20.66 arc(35.19,20.98) C6075599.2
NTC3: length 16.6
  Top Layer w0.203: C6075600.2 33.98,21.26 arc(33.73,21.37) 33.63,21.62 33.63,30.85 arc(33.44,31.82) 32.89,32.65 U237.2 32.74,34.68 arc(32.74,34.68) 32.73,34.69
  Top Layer w0.254: U58.12 34.62,20.67 arc(34.56,20.99) C6075600.2
NTC4: length 17.3
  Top Layer w0.203: R4247.1 arc(30.31,34.65) 30.31,34.64 U238.2 31.14,31.93 arc(31.69,31.11) 31.88,30.13 31.88,21.99 arc(32.09,21.48) 32.6,21.27 C6075601.2 arc(32.94,21.26) 32.97,21.25 33.39,20.82 arc(33.93,20.01) U58.13
PRES: length 23.5
  Top Layer w0.152: U58.18 29.09,17.13 arc(28.62,17.22) 28.23,17.49 v2(23.77,21.94)
  Top Layer w0.203: SW1.S arc(11.66,21.95) 11.66,21.95 C6075597.1 14.27,21.95 arc(14.27,21.95) v1(14.27,21.94)
  Bottom Layer w0.152: v2(23.77,21.94) 14.28,21.94 arc(14.27,21.94) v1(14.27,21.94)
RRR: length 36.7
  Top Layer w0.152: U58.6 37.43,18.13 arc(37.76,18.27) 37.9,18.61 37.9,19.18 arc(37.92,19.42) 37.98,19.66 arc(38.13,20.01) 38.37,20.32 38.44,20.38 arc(38.45,20.39) 38.46,20.4 38.66,20.61 arc(39.21,21.43) 39.41,22.4 v2(39.41,24.14) ; SW1.B v1(14.79,27.42)
  Inner2 w0.152: v1(14.79,27.42) 14.79,27.39 arc(15.53,25.59) 17.33,24.85 38.7,24.85 arc(39.2,24.64) v2(39.41,24.14)
SCL: length 59.1
  Top Layer w0.203: U228.5 45.63,29.67 arc(44.14,29.05) 43.52,27.56 arc(43.52,27.52) 43.52,27.48 43.52,10.7 arc(43.33,9.72) 42.78,8.9 38.65,4.77 arc(38.1,3.95) 37.91,2.98 37.91,2.32 35.87,4.36 arc(35.32,5.18) 35.12,6.16 U58.25 ; 37.91,2.32 37.91,1.3 arc(37.76,0.94) 37.4,0.79 33.58,0.79 arc(33.35,0.88) 33.25,1.12
SDA: length 54.5
  Top Layer w0.203: U228.4 45.43,30.17 arc(43.63,29.43) 42.89,27.63 42.89,11.02 arc(42.7,10.04) 42.14,9.22 v1(37.12,4.19) 36.37,4.95 arc(35.82,5.77) 35.62,6.74 U58.26 ; R4253.1 35.09,2.44 arc(35.24,2.41) 35.37,2.32
  Bottom Layer w0.203: v1(37.12,4.19) 35.45,2.53 arc(35.44,2.51) 35.42,2.5 arc(35.38,2.41) 35.37,2.32
SINKPWM: length 47.3
  Top Layer w0.152: v2(74.73,7.38) 74.73,10.77 74.73,10.77 arc(74.72,10.78) U219.1
  Top Layer w0.203: v2(36.13,18.39) 36.13,19.05 U58.9
  Bottom Layer w0.152: v2(74.73,7.38) 47.78,7.38 arc(46.81,7.57) 45.99,8.13 36.41,17.7 arc(36.2,18.02) v2(36.13,18.39)
SWCLK: length 13.3
  Top Layer w0.203: U58.22 25.38,7.02 arc(24.71,6.56) H11.3
SWDIO: length 12
  Top Layer w0.203: H11.2 25.51,8.95 arc(26.48,9.14) 27.31,9.69 U58.21
$1N6444: length 1.5
  Top Layer w0.254: LED4.2 78.76,5.41 arc(78.77,5.42) R4198.1
$1N6548: length 4.3
  Top Layer w0.508: 13.79,32.14 R4237.2 15.4,34.84 arc(15.39,34.84) U212.5 arc(15.38,34.85) 15.38,34.85
$1N6553: length 2.8
  Top Layer w0.203: 77.15,11.71 77.15,9.17 arc(77.13,9.06) 77.07,8.98
$1N6582: length 1.6
  Top Layer w0.508: LED7.1 7.22,33.08 arc(7.21,33.07) R4196.1
$1N19267: length 1.4
  Top Layer w0.254: R4197.1 66.97,3.98 arc(66.97,3.98) LED8.2
$1N28156: length 9.1
  Top Layer w0.203: R4211.1 64.33,0.52 72.82,0.52 LED9.2
$1N35736: length 8.5
  Top Layer w0.229: U241.5 57.98,18.26 arc(57.91,17.93) v2(57.72,17.65)
  Top Layer w0.508: v1(56.26,13.07) 56.27,13.07 R4250.1 55.03,14.18
  Inner2 w0.254: v1(56.26,13.07) 56.98,13.79 arc(57.53,14.61) 57.72,15.58 v2(57.72,17.65)
$1N35752: length 4.1
  Top Layer w0.254: U241.2 54.19,20.05 arc(54.14,20.04) 54.1,20.01
$1N35764: length 1.5
  Top Layer w0.229: U241.9 58.48,22.91
$1N38198: length 3.9
  Top Layer w0.254: U243.3 75.6,24.53 arc(75.65,24.56) 75.67,24.61
$1N40943: length 5.3
  Top Layer w0.508: 15.32,2.88 9.98,2.88 arc(9.98,2.88) 9.98,2.88

## Copper pours and planes (outline as drawn; the poured copper is in the pictures)
8.1V on Top Layer: 57.08,11.72 71.22,11.72 71.22,9.22 57.08,9.22
8.1V on Top Layer: 55.97,17.16 59.21,17.16 59.21,13.93 55.97,13.93
8.1V on Top Layer: 57.08,16.96 59.42,16.96 59.42,9.22 57.08,9.22
8.1V on Top Layer: 57.87,13.2 61.15,13.2 61.15,9.92 57.87,9.92
8.1V on Top Layer: 55.7,16.96 58.56,16.96 58.56,15.63 55.7,15.63
12V on Top Layer: 61.09,26.63 65.58,26.63 65.58,22.14 61.09,22.14
12V on Top Layer: 58.35,24.53 59.85,24.53 59.85,23.03 58.35,23.03
12V on Top Layer: 67.21,24.44 68.85,24.44 68.85,22.79 67.21,22.79
12V on Top Layer: 66.11,24.2 67.81,24.2 67.81,22.5 66.11,22.5
12V on Top Layer: 62.63,24.83 69.67,24.83 69.67,23.28 62.63,23.28
12V on Top Layer: 58.86,24.83 63.41,24.83 63.41,20.43 58.86,20.43
12V on Top Layer: 58.34,26.54 61.28,26.54 61.28,23.61 58.34,23.61
12V on Top Layer: 54.4,27.58 55.45,27.58 55.45,24.56 54.4,24.56
12V on Top Layer: 66.83,24.09 68.22,24.09 68.22,20.33 66.83,20.33
12V on Top Layer: 54.4,25.44 56.29,25.44 56.29,23.56 54.4,23.56
12V on Top Layer: 59.84,29.3 63.83,29.3 63.83,20.43 59.84,20.43
12V on Top Layer: 55.41,24.7 60.12,24.7 60.12,23.56 55.41,23.56
12VIN on Top Layer: 59.84,39.42 63.83,39.42 63.83,33.45 59.84,33.45
24V on Top Layer: 74.94,22.23 79.36,22.23 79.36,18.72 74.94,18.72
GND on Top Layer: 70.97,13.08 72.61,13.08 72.61,11.44 70.97,11.44
GND on Top Layer: 47.6,32.01 55.51,32.01 55.51,31.04 47.6,31.04
GND on Top Layer: 71.72,13.07 73.37,13.07 73.37,11.43 71.72,11.43
GND on Top Layer: 78.43,11.99 79.39,11.99 79.39,6.64 78.43,6.64
GND on Top Layer: 50.01,22.09 57.6,22.09 57.6,21.05 50.01,21.05
GND on Top Layer: 70.05,23.95 74.41,23.95 74.41,23.21 70.05,23.21
GND on Top Layer: -5.21,41.62 83.35,41.62 83.35,-2.63 -5.21,-2.63
GND on Top Layer: 71.67,13.14 72.68,13.14 72.68,9.28 71.67,9.28
GND on Bottom Layer: -8.64,46.29 83.89,46.29 83.89,-5 -8.64,-5
GND on Inner1: -12.91,43.95 83.23,43.95 83.23,-6.34 -12.91,-6.34
GND on Inner2: 49.12,23.99 79.46,23.99 79.46,9.17 49.12,9.17
GND on Inner2: 56.03,39.47 66.27,39.47 66.27,26.34 56.03,26.34
VDD on Top Layer: 45.22,26.84 48.56,26.84 48.56,25.22 45.22,25.22
VDD on Inner2: -10.21,44.05 83.81,44.05 83.81,-8.86 -10.21,-8.86
FAN- on Top Layer: 77.44,16.07 78.96,16.07 78.96,12.99 77.44,12.99
MCU12V on Top Layer: 49.95,27.65 54.02,27.65 54.02,26.64 49.95,26.64
TECA on Top Layer: 73.13,6.36 77.67,6.36 77.67,3.89 73.13,3.89
TECA on Top Layer: 75.14,5.65 77.67,5.65 77.67,1.05 75.14,1.05
TECA on Top Layer: 73.13,5.82 77.36,5.82 77.36,1.59 73.13,1.59
TECB on Top Layer: 68.45,5.83 72.49,5.83 72.49,1.79 68.45,1.79
TECB on Top Layer: 67.95,6.37 72.49,6.37 72.49,3.89 67.95,3.89
TECB on Top Layer: 67.95,5.67 70.47,5.67 70.47,1.05 67.95,1.05
$1N6565 on Top Layer: 57.49,29.78 57.94,29.78 57.94,25.24 57.49,25.24
$1N11196 on Top Layer: 66.43,39.44 73.99,39.44 73.99,34.85 66.43,34.85
$1N35752 on Top Layer: 55.99,20.3 57.1,20.3 57.1,19.19 55.99,19.19
$1N38178 on Top Layer: 70.89,22.93 72.37,22.93 72.37,18.72 70.89,18.72
$1N38178 on Top Layer: 71.27,20.47 74.03,20.47 74.03,18.72 71.27,18.72

Small or netless copper shapes (teardrops, artwork), in the pictures only: 183 on Top Layer, 11 on Bottom Layer, 10 on Inner2

## Text on the board
Top Silkscreen Layer: FAN- | FAN+ | DIO | CLK | GND | VDD | SDA | SCL | LINK | B | A | 加热 | 恒温 | 制冷
